# Altium project Carrier-Board-v1.0.PrjPcb (part 8 of 9)

## Sheet LTE_MODULE.SchDoc
size A4; SheetNumber: 19; SheetTotal: 20
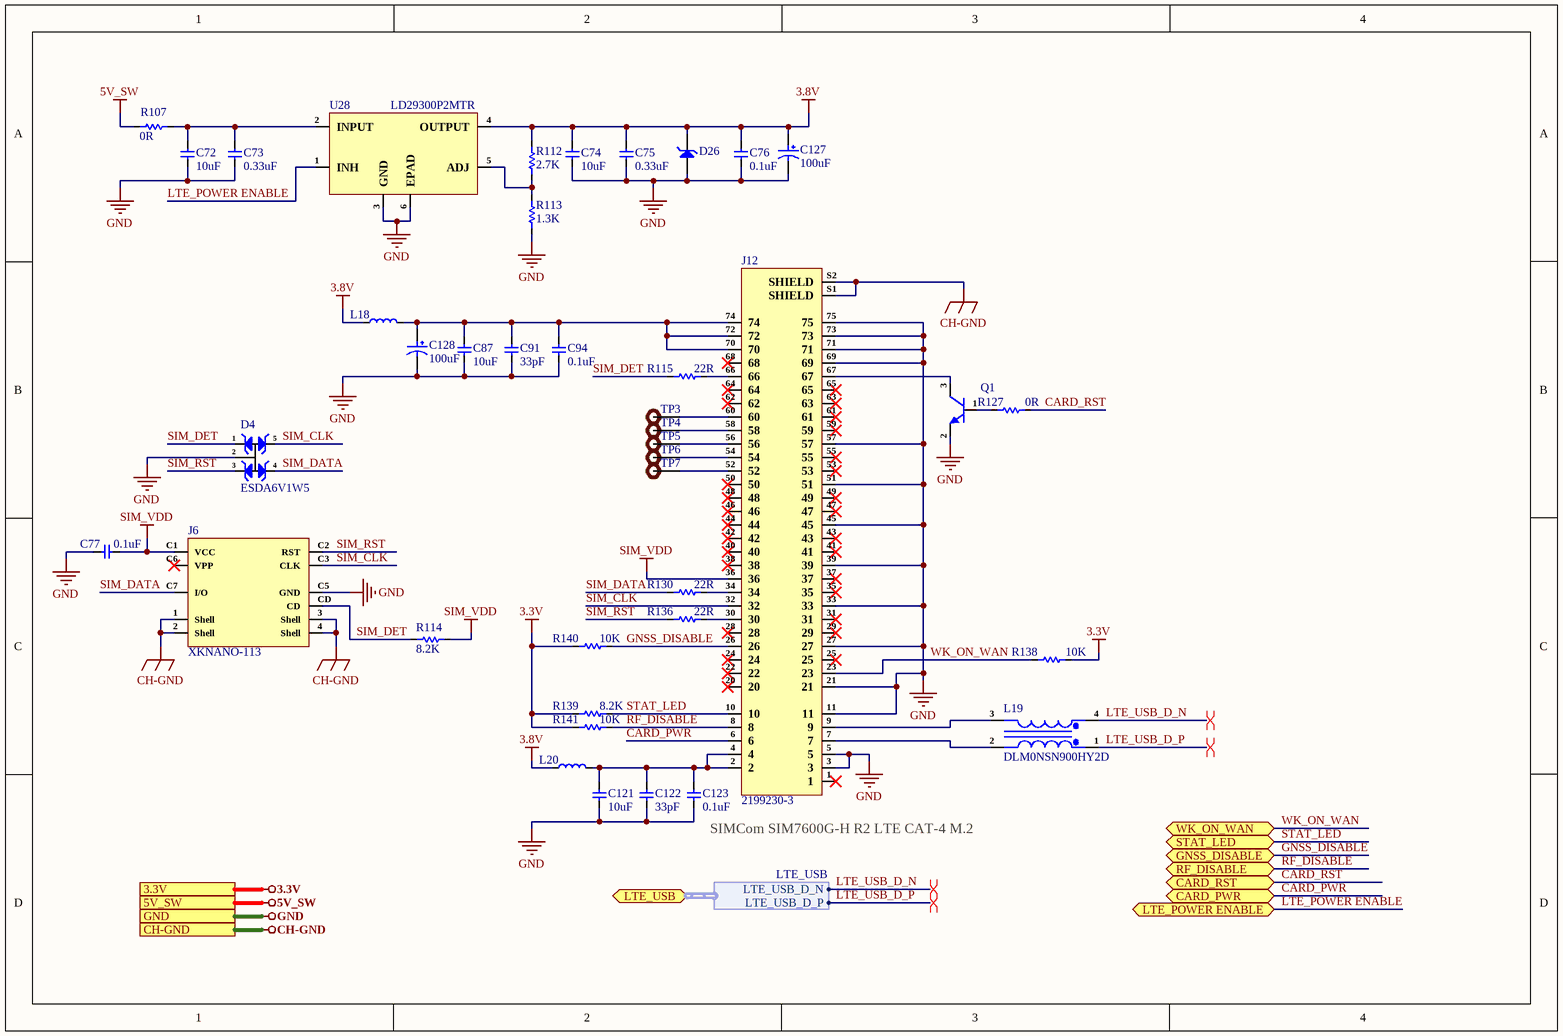
[diagram p18: LTE_MODULE.SchDoc]

### Parts
C72  10uF  [Cap-1206]
C73  0.33uF  [Cap-0603]
C74  10uF  [Cap-1206]
C75  0.33uF  [Cap-0603]
C76  0.1uF  [Cap-0402]
C77  0.1uF  [Cap-0402]
C87  10uF  [Cap-1206]
C91  33pF  [Cap-0603]
C94  0.1uF  [Cap-0402]
C121  10uF  [Cap-1206]
C122  33pF  [Cap-0603]
C123  0.1uF  [Cap-0402]
C127  100uF  [CAP-2917]
C128  100uF  [CAP-2917]
D4  ESDA6V1W5  [SOT-323-5]
D26  PZU3.9B2A,115  [SOD-323]  (value not drawn)
J6  XKNANO-113  [XKNANO-113]
J12  2199230-3  [2199230-3]
L18  BLM21PG220SN1D  [Ind-0805]  (value not drawn)
L19  DLM0NSN900HY2D  [DLM0NSN900HY2D]
L20  BLM21PG220SN1D  [Ind-0805]  (value not drawn)
Q1  DTC043ZEBTL  [SOT-416FL]  (value not drawn)
R107  0R  [Res-1206]
R112  2.7K  [Res-0603]
R113  1.3K  [Res-0603]
R114  8.2K  [Res-0603]
R115  22R  [Res-0402]
R127  0R  [Res-0603]
R130  22R  [Res-0402]
R136  22R  [Res-0402]
R138  10K  [Res-0603]
R139  8.2K  [Res-0603]
R140  10K  [Res-0603]
R141  10K  [Res-0603]
TP3  DNP  [Test-point]  (value not drawn)
TP4  DNP  [Test-point]  (value not drawn)
TP5  DNP  [Test-point]  (value not drawn)
TP6  DNP  [Test-point]  (value not drawn)
TP7  DNP  [Test-point]  (value not drawn)
U28  LD29300P2MTR  [P2PAK-4]

### Ports
3.3V (see Top_Sheet[4A], 03-CAN2_SPI_CAN_CONTROLLER[1D], APALIS_POWER_SUPPLY[1D], CAN2_SPI_CAN_CONTROLLER[1D], DC_DC_CONVERTER[1D], GPIO_NC_INTERFACE[4B], I2C_INTERFACE[1B], Reset_and_SDIO[1D]), 5V_SW (see Top_Sheet[4A], APALIS_POWER_SUPPLY[1D], CODEC_INTERFACE[1D], FUTURE_USE_CONNECTOR[1D], HDMI_INTERFACE[1D], USB3.0_INTERFACE[1D]), CARD_PWR (bidir, see Top_Sheet[4A], I2C_INTERFACE[2B]), CARD_RST (bidir, see Top_Sheet[4A], I2C_INTERFACE[2B]), CH-GND (see Top_Sheet[4A], ETHERNET_INTERFACE[1D], HDMI_INTERFACE[1D], MECHANICAL_FOR_PCB[1D], USB3.0_INTERFACE[1D]), GND (see Top_Sheet[4A], 03-CAN2_SPI_CAN_CONTROLLER[1D], APALIS_POWER_SUPPLY[1D], CAN2_SPI_CAN_CONTROLLER[1D], CODEC_INTERFACE[1D], CONNECTORS[1D], DC_DC_CONVERTER[1D], DIGITAL_I-O_O-P[1D], ETHERNET_INTERFACE[1D], FUTURE_USE_CONNECTOR[1D], GPIO_NC_INTERFACE[4B], HDMI_INTERFACE[1D], I2C_INTERFACE[1B], INPUT_SUPPLY_PROTECTION[1D], MECHANICAL_FOR_PCB[1D], MICRO_SD_CARD_INTERFACE[1D], Reset_and_SDIO[1D], UART_INTERFACE[1D], USB3.0_INTERFACE[1D]), GNSS_DISABLE (bidir, see Top_Sheet[4A], GPIO_NC_INTERFACE[2D]), LTE_POWER ENABLE (bidir, see Top_Sheet[4A], I2C_INTERFACE[2B]), LTE_USB (bidir, harness LTE_USB, see Top_Sheet[4A], USB3.0_INTERFACE[1C]), RF_DISABLE (bidir, see Top_Sheet[4A], GPIO_NC_INTERFACE[2D]), STAT_LED (bidir, see Top_Sheet[4A], GPIO_NC_INTERFACE[4D]), WK_ON_WAN (bidir, see Top_Sheet[4A], GPIO_NC_INTERFACE[4D])

### Harnesses
LTE_USB: LTE_USB_D_N, LTE_USB_D_P

### Nets
3.3V: R138.2 R139.1 R140.1 R141.1 ; port 3.3V
3.8V: C74.2 C75.2 C76.2 C127.1 D26.1(K) L18.1 L20.1 R112.2 U28.4(OUTPUT)
5V_SW: R107.1 ; port 5V_SW
CH-GND: J6.1(Shell) J6.2(Shell) J6.3(Shell) J6.4(Shell) J12.S1(SHIELD) J12.S2(SHIELD) ; port CH-GND
GND: C72.1 C73.1 C74.1 C75.1 C76.1 C77.2 C87.1 C91.1 C94.1 C121.1 C122.1 C123.1 C127.2 C128.2 D4.2(A) D26.2(A) J6.C5(GND) J12.3 J12.5 J12.11 J12.21 J12.27 J12.33 J12.39 J12.45 J12.51 J12.57 J12.69 J12.71 J12.73 J12.75 Q1.2(E) R113.1 U28.3(GND) U28.6(EPAD) ; port GND
SIM_VDD: C77.1 J6.C1(VCC) J12.36 R114.2
CARD_PWR: J12.6 ; port CARD_PWR
CARD_RST: R127.2 ; port CARD_RST
GNSS_DISABLE: J12.26 R140.2 ; port GNSS_DISABLE
LTE_POWER ENABLE: U28.1(INH) ; port LTE_POWER ENABLE
LTE_USB_D_N: L19.4 ; port LTE_USB.LTE_USB_D_N  [project net LTE_USB.LTE_USB_D_N]
LTE_USB_D_P: L19.1 ; port LTE_USB.LTE_USB_D_P  [project net LTE_USB.LTE_USB_D_P]
RF_DISABLE: J12.8 R141.2 ; port RF_DISABLE
SIM_CLK: D4.5(K) J6.C3(CLK) J12.32
SIM_DATA: D4.4(K) J6.C7(I/O) R130.1
SIM_DET: D4.1(K) J6.CD R114.1 R115.1
SIM_RST: D4.3(K) J6.C2(RST) R136.1
STAT_LED: J12.10 R139.2 ; port STAT_LED
WK_ON_WAN: J12.23 R138.1 ; port WK_ON_WAN
NetC72_2: C72.2 C73.2 R107.2 U28.2(INPUT)
NetC87_2: C87.2 C91.2 C94.2 C128.1 J12.70 J12.72 J12.74 L18.2
NetC121_2: C121.2 C122.2 C123.2 J12.2 J12.4 L20.2
NetJ12_7: J12.7 L19.2
NetJ12_9: J12.9 L19.3
NetJ12_30: J12.30 R136.2
NetJ12_34: J12.34 R130.2
NetJ12_52: J12.52 TP7.1
NetJ12_54: J12.54 TP6.1
NetJ12_56: J12.56 TP5.1
NetJ12_58: J12.58 TP4.1
NetJ12_60: J12.60 TP3.1
NetJ12_66: J12.66 R115.2
NetJ12_67: J12.67 Q1.3(C)
NetQ1_1: Q1.1(B) R127.1
NetR112_1: R112.1 R113.2 U28.5(ADJ)

Not connected (* = marked no-connect by the designer): J6 C6(VPP)*; J12 1* 20* 22* 24* 25* 28* 29* 31* 35* 37* 38* 40* 41* 42* 43* 44* 46* 47* 48* 49* 50* 53* 55* 59* 61* 62* 63* 64* 65* 68*

### Layout directives
differential pair; differential pair class LTE USB; rule Matched Net Lengths [Tolerance = 0.508mm]; rule Impedance Constraint [Min = 115.0    Max = 125.0    ]: LTE_USB.LTE_USB_D_N, LTE_USB.LTE_USB_D_P

### Notes on the sheet
- SIMCom SIM7600G-H R2 LTE CAT-4 M.2

### Library data of the parts
C72 C74 C87 C121 = C1206C106K4RACAUTO: CAP CER 10UF 16V X7R 1206; Manufacturer: KEMET; Supplier: Mouser; Supplier Part Number: 80-C1206C106K4RAUTO; Manufacturer Part Number: C1206C106K4RACAUTO; RoHS: Yes; Category: Ceramic Capacitors; Stock: 96894; Pricing: 1=0.45, 10=0.218, 50=0.218, 100=0.141, 1000=0.119, 10000=0.096 (USD); ComponentLink1URL: https://datasheet.ciiva.com/5969/1776110-5969442.pdf?src-supplier=Farnell; ComponentLink1Description: https://datasheet.ciiva.com/5969/1776110-5969442.pdf?src-supplier=Farnell; ComponentLink2URL: https://datasheet.ciiva.com/7729/1776110-7729820.pdf?src-supplier=Element14; ComponentLink2Description: https://datasheet.ciiva.com/7729/1776110-7729820.pdf?src-supplier=Element14; ComponentLink3URL: https://datasheet.ciiva.com/22704/1776110-22704890.pdf?src-supplier=Element14; ComponentLink3Description: https://datasheet.ciiva.com/22704/1776110-22704890.pdf?src-supplier=Element14
C73 C75 = CGA3E1X7R1C334K080AC: CAP CER 0.33UF 16V X7R 0603; Manufacturer: TDK; Material: 4241ConductorMaterial; Supplier: Avnet; Supplier Part Number: 52W9636; Manufacturer Part Number: CGA3E1X7R1C334K080AC; RoHS: Yes; Category: Ceramic Capacitors; Stock: 4000; Pricing: 1=0.023 (USD); ComponentLink1URL: https://datasheet.ciiva.com/26834/getdatasheetpartid-734961-26834531.pdf?src-supplier=Verical; ComponentLink1Description: https://datasheet.ciiva.com/26834/getdatasheetpartid-734961-26834531.pdf?src-supplier=Verical; ComponentLink2URL: https://datasheet.ciiva.com/24217/cga3e1x7r1c334k080ac-265890-24217429.pdf?src-supplier=Mouser; ComponentLink2Description: https://datasheet.ciiva.com/24217/cga3e1x7r1c334k080ac-265890-24217429.pdf?src-supplier=Mouser; ComponentLink3URL: https://datasheet.ciiva.com/7975/1807242-7975343.pdf?src-supplier=Element14; ComponentLink3Description: https://datasheet.ciiva.com/7975/1807242-7975343.pdf?src-supplier=Element14
C76 C77 C94 C123 = C0402C104K4REC7867: as C59 on sheet FUTURE_USE_CONNECTOR; Supplier: Digi-Key; Supplier Part Number: 399-C0402C104K4REC7867CT-ND; Manufacturer Part Number: C0402C104K4REC7867; RoHS: No; Category: Ceramic Capacitors; Stock: 10918; Pricing: 1=0.1, 10=0.072, 50=0.0408, 100=0.0338, 500=0.02372, 1000=0.01963, 2500=0.01827, 5000=0.01672 (USD)
C91 C122 = C0603C330J5GACTU: Multilayer Ceramic Capacitor, 33 pF, 50 V, ± 5%, C0G (NP0), 0603 [1608 Metric]; Manufacturer: KEMET; Material: 4241ConductorMaterial; Voltage Rating (DC): 50V; Temperature Coefficient: 30ppm/°C; Dissipation Factor: 0.1%; Supplier: Mouser; Supplier Part Number: 80-C0603C330J5G; Manufacturer Part Number: C0603C330J5GACTU; RoHS: Yes; Category: Ceramic Capacitors; Stock: 156407; Pricing: 1=0.14, 10=0.055, 50=0.055, 100=0.032, 1000=0.027, 10000=0.019 (USD); Mounting Technology: Surface Mount,PCB; Case/Package: 0603; Pins: 2; Case Code (Metric): 1608; Case Code (Imperial): 0603; Min Operating Temperature: -55°C; Max Operating Temperature: 125°C; Value: 33pF; Tolerance: 5%; Packaging: Tape and Reel; Dielectric: C0G; Package Quantity: 4000; Voltage Rating: 50V; Termination: SMD/SMT; Voltage: 50V; Series: SMD Comm C0G; Construction: Flat; Length: 1.6mm; Width: 0.8mm; Height: 0.8mm; Lead Pitch: 0.7mm; Depth: 0.8mm; Radiation Hardening: No; Reach SVHC Compliant: No; Lead Free: 5697LeadFree; RoHS Compliant: Yes; ComponentLink1URL: https://datasheet.ciiva.com/6177/1732690-6177173.pdf?src-supplier=Farnell; ComponentLink1Description: https://datasheet.ciiva.com/6177/1732690-6177173.pdf?src-supplier=Farnell; ComponentLink2URL: https://datasheet.ciiva.com/7823/1732690-7823738.pdf?src-supplier=Element14; ComponentLink2Description: https://datasheet.ciiva.com/7823/1732690-7823738.pdf?src-supplier=Element14; ComponentLink3URL: https://datasheet.ciiva.com/7824/kem-c1003-c0g-smd-7824030.pdf?src-supplier=Element14; ComponentLink3Description: https://datasheet.ciiva.com/7824/kem-c1003-c0g-smd-7824030.pdf?src-supplier=Element14; ComponentLink4URL: https://datasheet.ciiva.com/28668/1789732-28668661.pdf?src-supplier=Element14; ComponentLink4Description: https://datasheet.ciiva.com/28668/1789732-28668661.pdf?src-supplier=Element14; Item Type: Capacitor
C127 C128 = TAJD107M020RNJ: Cap Tant Solid 100uF 20V D CASE 20% (7.3 X 4.3 X 2.9mm) Inward L SMD 7343-31 0.5 Ohm 125C T/R; Manufacturer: Kyocera AVX; Life (Hours): 2000Hour; Ripple Current: 548mA; Supplier: Digi-Key; Supplier Part Number: 478-8907-1-ND; Manufacturer Part Number: TAJD107M020RNJ; RoHS: Yes; Category: Tantalum Capacitors; Stock: 1507; Pricing: 1=1.27, 10=1.006, 50=0.8716, 100=0.7542 (USD); ComponentLink1URL: https://datasheet.ciiva.com/29503/taj-29503388.pdf?src-supplier=Digi-Key; ComponentLink1Description: https://datasheet.ciiva.com/29503/taj-29503388.pdf?src-supplier=Digi-Key; ComponentLink2URL: https://datasheet.ciiva.com/29503/taj-29503389.pdf?src-supplier=Digi-Key; ComponentLink2Description: https://datasheet.ciiva.com/29503/taj-29503389.pdf?src-supplier=Digi-Key; ComponentLink3URL: https://datasheet.ciiva.com/29503/taj-29503390.pdf?src-supplier=Digi-Key; ComponentLink3Description: https://datasheet.ciiva.com/29503/taj-29503390.pdf?src-supplier=Digi-Key; ComponentLink4URL: https://datasheet.ciiva.com/12886/taj-27497-12886634.pdf?src-supplier=Mouser; ComponentLink4Description: https://datasheet.ciiva.com/12886/taj-27497-12886634.pdf?src-supplier=Mouser; ComponentLink5URL: https://datasheet.ciiva.com/11229/taj-11229143.pdf?src-supplier=Avnet; ComponentLink5Description: https://datasheet.ciiva.com/11229/taj-11229143.pdf?src-supplier=Avnet
D4 = ESDA6V1W5: TVS DIODE 3VWM SOT3235; Manufacturer: STMicroelectronics; Direction: Unidirectional; Number of Elements: 4; Capacitance: 90pF; Reverse Breakdown Voltage: 6.1V; Operating Supply Voltage: 3V; Element Configuration: Common Anode; Breakdown Voltage: 7.2V; Peak Pulse Power: 150W; Power Line Protection: No; Leakage Current: 1uA; Test Current: 1mA; ESD Protection: Yes; Peak Pulse Current: 15A; Diode Type: ZENER; Supplier 1: Arrow Electronics; Manufacturer Part Number: ESDA6V1W5; RoHS: Yes; Category: TVS Diodes; Stock 1: 3304; Pricing 1: 1=0.46690, 10=0.38770, 25=0.37260, 100=0.27930, 250=0.27650, 500=0.23480, 1000=0.21350, 3000=0.10000 (USD); Mount: Surface Mount; Case/Package: SOT-323; Number of Pins: 5; Min Operating Temperature: -40°C; Max Operating Temperature: 125°C; Packaging: Tape and Reel; Package Quantity: 1; Polarity: Unidirectional; Number of Channels: 4; Termination: SMD/SMT; Number of Unidirectional Channels: 4; Reverse Standoff Voltage: 3V; Min Breakdown Voltage: 6.1V; Working Voltage: 3V; Max Reverse Leakage Current: 1uA; Max Breakdown Voltage: 7.2V; Voltage Rating (DC): 6.1V; Resistor Type: Zener; Series: ESDA, TRANSIL™; Length: 2.2mm; Width: 1.35mm; Height: 1mm; Depth: 1.35mm; Radiation Hardening: No; Reach SVHC Compliant: Yes; Lead Free: Lead Free; RoHS Compliant: Yes; ComponentLink1URL: https://datasheet.ciiva.com/15143/getdatasheetpartid-134557-15143650.pdf?src-supplier=Verical; ComponentLink1Description: https://datasheet.ciiva.com/15143/getdatasheetpartid-134557-15143650.pdf?src-supplier=Verical; ComponentLink2URL: https://datasheet.ciiva.com/1276/1671027-1276908.pdf?src-supplier=Element14; ComponentLink2Description: https://datasheet.ciiva.com/1276/1671027-1276908.pdf?src-supplier=Element14; ComponentLink3URL: https://datasheet.ciiva.com/22695/1671027-22695673.pdf?src-supplier=Element14; ComponentLink3Description: https://datasheet.ciiva.com/22695/1671027-22695673.pdf?src-supplier=Element14; ComponentLink4URL: https://datasheet.ciiva.com/338/cd00064033-338380.pdf?src-supplier=Digi-Key; ComponentLink4Description: https://datasheet.ciiva.com/338/cd00064033-338380.pdf?src-supplier=Digi-Key; ComponentLink5URL: https://datasheet.ciiva.com/338/cd00064033-338379.pdf?src-supplier=Digi-Key; ComponentLink5Description: https://datasheet.ciiva.com/338/cd00064033-338379.pdf?src-supplier=Digi-Key; ComponentLink6URL: https://datasheet.ciiva.com/338/cd00064033-338381.pdf?src-supplier=Digi-Key; ComponentLink6Description: https://datasheet.ciiva.com/338/cd00064033-338381.pdf?src-supplier=Digi-Key; ComponentLink7URL: https://datasheet.ciiva.com/41443/001184222-da-01-en-transil-array-da-esda6v1w5-sot-323-5-stm-41443642.pdf?src-supplier=Conrad; ComponentLink7Description: https://datasheet.ciiva.com/41443/001184222-da-01-en-transil-array-da-esda6v1w5-sot-323-5-stm-41443642.pdf?src-supplier=Conrad; Supplier Part Number 1: ESDA6V1W5; LCSC Part Number: C48677; Item Type: Diode
D26 = PZU3.9B2A,115: DIODE ZENER 3.9V 320MW SOD323; Manufacturer: Nexperia; Impedance: 90R; Max Reverse Leakage Current: 1uA; Power Dissipation: 310mW; Tolerance: 2%; Voltage Tolerance: 5%; Zener Current: 200mA; Element Configuration: 5460ElementConfiguration; Supplier: Avnet; Supplier Part Number: PZU3.9B2A,115; Manufacturer Part Number: PZU3.9B2A,115; RoHS: Yes; Category: Zener Diodes; Stock: 76880; Pricing: 13228=0.02646, 14000=0.02589, 27000=0.02533, 67000=0.02476, 140000=0.02419, 670000=0.02363, 1400000=0.02306 (USD); Mounting Technology: 8Mount; Case/Package: 92Case; Min Operating Temperature: -55°C; Max Operating Temperature: 150°C; Max Power Dissipation: 320mW; Packaging: 10Packaging; Zener Voltage: 3.9V; Radiation Hardening: 5898YesNo; RoHS Compliant: Yes; ComponentLink1URL: https://datasheet.octopart.com/PZU3.9B2A%2C115-Nexperia-datasheet-140812947.pdf?src-supplier=Farnell; ComponentLink1Description: https://datasheet.octopart.com/PZU3.9B2A%2C115-Nexperia-datasheet-140812947.pdf?src-supplier=Farnell; Item Type: Diode Zener
J6 = XKNANO-113: Copper Alloy Self bomb Gold plating 1.25mm Deck -40℃~+85℃ 260℃ NanoSIM SMD SIM Card Connectors ROHS; Manufacturer: XKB Connectivity; Manufacturer Part Number: XKNANO-113; Package: SMD Custom; LCSC Part Number: C381071; Item Type: SIM Card Connectors; ComponentLink1Description: LCSC; ComponentLink1URL: https://www.lcsc.com/product-detail/SIM-Card-Connectors_XKB-Connectivity-XKNANO-113_C381071.html
J12 = 2199230-3: M2 KEY B Connector .5PITCH 4.2H KEY B EMBOSS NGFF MINICARD; Manufacturer: TE Connectivity; Gender: Female; Number of Positions: 67; PCB Mounting Orientation: Right Angle; Contact Current Rating: 500mA; Voltage Rating: 50V; Insulation Resistance: 500MR; Pitch: 0.5mm; Row Spacing: 7.55mm; Supplier: Rs; Supplier Part Number: 2175444; Manufacturer Part Number: 2199230-3; RoHS: Yes; Category: Card Edge Connectors; Stock: 5895; Pricing: 1000=0.84 (GBP); Mounting Technology: Surface Mount; Contact Plating: Gold,Matte; Contact Material: Copper Alloy; Color: Black; Housing Color: Black; Insulation Material: Thermoplastic; Housing Material: Thermoplastic; Min Operating Temperature: -40°C; Max Operating Temperature: 80°C; Number of Rows: 2; Packaging: Tape and Reel; Package Quantity: 1000; Termination: Solder; Series: -; Contact Type: -; Current Rating: 500mA; Number of Contacts: 67; Orientation: Right Angle; Max Voltage Rating (AC): 50V; Length: 0.862inch; Width: 8.7mm; Height: 0.165inch; Radiation Hardening: No; ELV: Compliant; RoHS Compliant: Yes; Reach SVHC Compliant: Unknown
L18 L20 = BLM21PG220SN1D: FERRITE BEAD 22 OHM 0805 1LN; Manufacturer: Murata; Supplier: Rs; Supplier Part Number: 7241539P; Manufacturer Part Number: BLM21PG220SN1D; RoHS: Yes; Category: Ferrite Beads and Chips; Stock: 10325; Pricing: 500=0.043, 1000=0.038, 2500=0.033, 5000=0.03 (GBP); ComponentLink1URL: https://datasheet.ciiva.com/14122/anblm21p-data-e-14122211.pdf?src-supplier=Distrelec; ComponentLink1Description: https://datasheet.ciiva.com/14122/anblm21p-data-e-14122211.pdf?src-supplier=Distrelec; ComponentLink2URL: https://datasheet.ciiva.com/11799/0900766b81275e31-11799177.pdf?src-supplier=Rs; ComponentLink2Description: https://datasheet.ciiva.com/11799/0900766b81275e31-11799177.pdf?src-supplier=Rs; ComponentLink3URL: https://datasheet.ciiva.com/29700/1845312-29700540.pdf?src-supplier=Jameco; ComponentLink3Description: https://datasheet.ciiva.com/29700/1845312-29700540.pdf?src-supplier=Jameco; ComponentLink4URL: https://datasheet.ciiva.com/16291/l0110s0100blm21p-16291622.pdf?src-supplier=Future+Electronics; ComponentLink4Description: https://datasheet.ciiva.com/16291/l0110s0100blm21p-16291622.pdf?src-supplier=Future+Electronics; ComponentLink5URL: https://datasheet.ciiva.com/8021/5160-8021589.pdf?src-supplier=Element14; ComponentLink5Description: https://datasheet.ciiva.com/8021/5160-8021589.pdf?src-supplier=Element14; ComponentLink6URL: https://datasheet.ciiva.com/8021/5160-8021591.pdf?src-supplier=Element14; ComponentLink6Description: https://datasheet.ciiva.com/8021/5160-8021591.pdf?src-supplier=Element14; ComponentLink7URL: https://datasheet.ciiva.com/6211/l0110s0100blm21p-6211741.pdf?src-supplier=Digi-Key; ComponentLink7Description: https://datasheet.ciiva.com/6211/l0110s0100blm21p-6211741.pdf?src-supplier=Digi-Key; ComponentLink8URL: https://datasheet.ciiva.com/3081/l0110s0100blm21p-3081653.pdf?src-supplier=Avnet; ComponentLink8Description: https://datasheet.ciiva.com/3081/l0110s0100blm21p-3081653.pdf?src-supplier=Avnet; ComponentLink9URL: https://datasheet.ciiva.com/41449/001171738-da-01-en-chip-drossel0805-22r0-6000ma-2-0x1-25mm-41449366.pdf?src-supplier=Conrad; ComponentLink9Description: https://datasheet.ciiva.com/41449/001171738-da-01-en-chip-drossel0805-22r0-6000ma-2-0x1-25mm-41449366.pdf?src-supplier=Conrad; LCSC Part Number: C88993; Item Type: Ferrite Bead
L19 = DLM0NSN900HY2D: CMC 100MA 2LN 90 OHM SMD; Manufacturer: Murata; Impedance: 90R; Number of Lines: 2; Voltage Rating (DC): 5V; Supplier: Rs; Supplier Part Number: 2235027P; Manufacturer Part Number: DLM0NSN900HY2D; RoHS: Yes; Category: Common Mode Chokes; Stock: 4650; Pricing: 250=0.066, 500=0.054, 1000=0.05, 2500=0.043 (GBP); Mounting Technology: Surface Mount; Case Code (Imperial): 0302; Case Code (Metric): 0806; Min Operating Temperature: -40°C; Max Operating Temperature: 85°C; Series: -; Max Current Rating: 100mA; Length: 850um; Width: 650um; RoHS Compliant: Yes; ComponentLink1URL: https://datasheet.octopart.com/DLM0NSN900HY2D-Murata-datasheet-140316808.pdf?src-supplier=Element14; ComponentLink1Description: https://datasheet.octopart.com/DLM0NSN900HY2D-Murata-datasheet-140316808.pdf?src-supplier=Element14; ComponentLink2URL: https://www.murata.com/en-global/products/productdata/8799424610334/EFLD0009.pdf?src-supplier=Digi-Key; ComponentLink2Description: https://www.murata.com/en-global/products/productdata/8799424610334/EFLD0009.pdf?src-supplier=Digi-Key; ComponentLink3URL: https://datasheet.octopart.com/DLM0NSN900HY2D-Murata-datasheet-140316808.pdf?src-supplier=Newark; ComponentLink3Description: https://datasheet.octopart.com/DLM0NSN900HY2D-Murata-datasheet-140316808.pdf?src-supplier=Newark
Q1 = DTC043ZEBTL: TRANS PREBIAS NPN 50V EMT3F; Manufacturer: Rohm; Supplier: Mouser; Supplier Part Number: 755-DTC043ZEBTL; Manufacturer Part Number: DTC043ZEBTL; RoHS: Yes; Category: BJTs; Stock: 9280; Pricing: 1=0.19, 10=0.182, 50=0.182, 100=0.099, 1000=0.042, 10000=0.031 (USD); ComponentLink1URL: http://www.mouser.com/ds/2/348/tc043zebtl-e-1019210.pdf?src-supplier=Mouser; ComponentLink1Description: http://www.mouser.com/ds/2/348/tc043zebtl-e-1019210.pdf?src-supplier=Mouser; ComponentLink2URL: http://www.farnell.com/datasheets/2644341.pdf?src-supplier=Newark; ComponentLink2Description: http://www.farnell.com/datasheets/2644341.pdf?src-supplier=Newark; ComponentLink3URL: https://datasheet.octopart.com/DTC043ZEBTL-Rohm-datasheet-136771937.pdf?src-supplier=Future+Electronics; ComponentLink3Description: https://datasheet.octopart.com/DTC043ZEBTL-Rohm-datasheet-136771937.pdf?src-supplier=Future+Electronics; ComponentLink4URL: http://rohmfs.rohm.com/en/techdata_basic/transistor/taping/EMT3_TL_taping.pdf?src-supplier=Digi-Key; ComponentLink4Description: http://rohmfs.rohm.com/en/techdata_basic/transistor/taping/EMT3_TL_taping.pdf?src-supplier=Digi-Key; ComponentLink5URL: http://rohmfs.rohm.com/en/products/databook/datasheet/discrete/transistor/digital/dtc043zmt2l-e.pdf?src-supplier=Digi-Key; ComponentLink5Description: http://rohmfs.rohm.com/en/products/databook/datasheet/discrete/transistor/digital/dtc043zmt2l-e.pdf?src-supplier=Digi-Key; ComponentLink6URL: http://avnetexpress.avnet.com/store/em/EMController/Digital-BJT/Rohm-Semiconductor/DTC043ZEBTL/_/R-16023578/A-16023578/rohmfs.rohm.com/en/products/databook/datasheet/discrete/transistor/digital/dtc043zeb.pdf?src-supplier=Avnet; ComponentLink6Description: http://avnetexpress.avnet.com/store/em/EMController/Digital-BJT/Rohm-Semiconductor/DTC043ZEBTL/_/R-16023578/A-16023578/rohmfs.rohm.com/en/products/databook/datasheet/discrete/transistor/digital/dtc043zeb.pdf?src-supplier=Avnet
R107 = RC1206JR-070RL: as R137 on sheet DC_DC_CONVERTER; Supplier: Future Electronics; Supplier Part Number: 1070203; Manufacturer Part Number: RC1206JR-070RL; RoHS: Yes; Category: Chip SMD Resistors; Stock: 615000; Pricing: 5000=0.0047, 25000=0.0045, 100000=0.0042, 250000=0.0041, 625000=0.0038 (USD); Case/Package: 1206; Contact Plating: Tin,Matte; Case Code (Metric): 3216; Case Code (Imperial): 1206; Min Operating Temperature: -55°C; Max Operating Temperature: 155°C; Resistor Type: Thick Film,Carbon Film; Packaging: Tape and Reel; Package Quantity: 1; Number of Terminations: 2; Termination: SMD/SMT; Max Power Dissipation: 250mW; Series: RC; Resistance Tolerance: 5%; Technology: THICK FILM; Features: Moisture Resistant; Voltage Rating (AC): 200V; Length: 0.122inch; Width: 0.063inch; Height: 0.026inch; Depth: 1.6mm; Lead Free: Lead Free; RoHS Compliant: Yes; Reach SVHC Compliant: Unknown; ComponentLink1URL: https://datasheet.ciiva.com/11808/0900766b80c6630a-11808156.pdf?src-supplier=Rs; ComponentLink1Description: https://datasheet.ciiva.com/11808/0900766b80c6630a-11808156.pdf?src-supplier=Rs; ComponentLink2URL: https://datasheet.ciiva.com/29181/402222-da-01-en-smd-widerstand-0-ohm-1206-29181568.pdf?src-supplier=Conrad; ComponentLink2Description: https://datasheet.ciiva.com/29181/402222-da-01-en-smd-widerstand-0-ohm-1206-29181568.pdf?src-supplier=Conrad; ComponentLink3URL: https://datasheet.ciiva.com/7983/444357-7983807.pdf?src-supplier=Element14; ComponentLink3Description: https://datasheet.ciiva.com/7983/444357-7983807.pdf?src-supplier=Element14; ComponentLink4URL: https://datasheet.ciiva.com/22747/1692832-22747541.pdf?src-supplier=Element14; ComponentLink4Description: https://datasheet.ciiva.com/22747/1692832-22747541.pdf?src-supplier=Element14; ComponentLink5URL: https://datasheet.ciiva.com/46445/444357-46445719.pdf?src-supplier=Element14; ComponentLink5Description: https://datasheet.ciiva.com/46445/444357-46445719.pdf?src-supplier=Element14; ComponentLink6URL: https://datasheet.ciiva.com/2458/pyu-rc1206-51-rohs-l-4-2458669.pdf?src-supplier=Digi-Key; ComponentLink6Description: https://datasheet.ciiva.com/2458/pyu-rc1206-51-rohs-l-4-2458669.pdf?src-supplier=Digi-Key; ComponentLink7URL: https://datasheet.ciiva.com/2458/pyu-rc1206-51-rohs-l-4-2458670.pdf?src-supplier=Digi-Key; ComponentLink7Description: https://datasheet.ciiva.com/2458/pyu-rc1206-51-rohs-l-4-2458670.pdf?src-supplier=Digi-Key; ComponentLink8URL: https://datasheet.ciiva.com/2458/pyu-rc1206-51-rohs-l-4-2458668.pdf?src-supplier=Digi-Key; ComponentLink8Description: https://datasheet.ciiva.com/2458/pyu-rc1206-51-rohs-l-4-2458668.pdf?src-supplier=Digi-Key; ComponentLink9URL: https://datasheet.ciiva.com/7857/1692832-7857422.pdf?src-supplier=Element14; ComponentLink9Description: https://datasheet.ciiva.com/7857/1692832-7857422.pdf?src-supplier=Element14; ComponentLink10URL: https://datasheet.ciiva.com/7857/1692832-7857421.pdf?src-supplier=Element14; ComponentLink10Description: https://datasheet.ciiva.com/7857/1692832-7857421.pdf?src-supplier=Element14; ComponentLink11URL: https://datasheet.ciiva.com/17035/pyu-rc1206-51-rohs-l-4-17035512.pdf?src-supplier=Future+Electronics; ComponentLink11Description: https://datasheet.ciiva.com/17035/pyu-rc1206-51-rohs-l-4-17035512.pdf?src-supplier=Future+Electronics
R112 = ERA-3AEB272V: as R37 on sheet INPUT_SUPPLY_PROTECTION; Supplier: Mouser; Supplier Part Number: 667-ERA-3AEB272V; Manufacturer Part Number: ERA-3AEB272V; RoHS: Yes; Category: Chip SMD Resistors; Stock: 13910; Pricing: 1=0.34, 10=0.224, 50=0.224, 100=0.09, 1000=0.05, 10000=0.036 (USD); ComponentLink1URL: https://datasheet.ciiva.com/11808/0900766b80fe20f7-11808049.pdf?src-supplier=Rs; ComponentLink1Description: https://datasheet.ciiva.com/11808/0900766b80fe20f7-11808049.pdf?src-supplier=Rs; ComponentLink2URL: https://datasheet.ciiva.com/29183/450927-da-01-en-widerstand-0603-era-29183778.pdf?src-supplier=Conrad; ComponentLink2Description: https://datasheet.ciiva.com/29183/450927-da-01-en-widerstand-0603-era-29183778.pdf?src-supplier=Conrad; ComponentLink3URL: https://datasheet.ciiva.com/9196/aoa0000ce26-9196935.pdf?src-supplier=Avnet; ComponentLink3Description: https://datasheet.ciiva.com/9196/aoa0000ce26-9196935.pdf?src-supplier=Avnet; ComponentLink4URL: https://datasheet.ciiva.com/43457/485442-43457768.pdf?src-supplier=Farnell; ComponentLink4Description: https://datasheet.ciiva.com/43457/485442-43457768.pdf?src-supplier=Farnell; ComponentLink5URL: https://datasheet.ciiva.com/43455/485442-43455224.pdf?src-supplier=Farnell; ComponentLink5Description: https://datasheet.ciiva.com/43455/485442-43455224.pdf?src-supplier=Farnell; ComponentLink6URL: https://datasheet.ciiva.com/48530/era-eng-tds-48530485.pdf?src-supplier=Distrelec; ComponentLink6Description: https://datasheet.ciiva.com/48530/era-eng-tds-48530485.pdf?src-supplier=Distrelec; ComponentLink7URL: https://datasheet.ciiva.com/48425/era-eng-tds-48425448.pdf?src-supplier=Distrelec; ComponentLink7Description: https://datasheet.ciiva.com/48425/era-eng-tds-48425448.pdf?src-supplier=Distrelec; ComponentLink8URL: https://datasheet.ciiva.com/46422/485442-46422632.pdf?src-supplier=Element14; ComponentLink8Description: https://datasheet.ciiva.com/46422/485442-46422632.pdf?src-supplier=Element14; ComponentLink9URL: https://datasheet.ciiva.com/46422/485442-46422633.pdf?src-supplier=Element14; ComponentLink9Description: https://datasheet.ciiva.com/46422/485442-46422633.pdf?src-supplier=Element14; ComponentLink10URL: https://datasheet.ciiva.com/46422/485442-46422634.pdf?src-supplier=Element14; ComponentLink10Description: https://datasheet.ciiva.com/46422/485442-46422634.pdf?src-supplier=Element14; ComponentLink11URL: https://datasheet.ciiva.com/6000/485442-6000521.pdf?src-supplier=Farnell; ComponentLink11Description: https://datasheet.ciiva.com/6000/485442-6000521.pdf?src-supplier=Farnell; ComponentLink12URL: https://datasheet.ciiva.com/6000/485442-6000524.pdf?src-supplier=Farnell; ComponentLink12Description: https://datasheet.ciiva.com/6000/485442-6000524.pdf?src-supplier=Farnell
R113 = RT0603BRD071K3L: RES SMD 1.3K OHM 0.1% 1/10W 0603; Manufacturer: Yageo; Supplier: Future Electronics; Supplier Part Number: 1104750; Manufacturer Part Number: RT0603BRD071K3L; RoHS: Yes; Category: Chip SMD Resistors; Stock: 25000; Pricing: 5000=0.0354, 15000=0.0341, 25000=0.0335, 50000=0.0327, 100000=0.0315 (USD); ComponentLink1URL: https://datasheet.ciiva.com/8895/pyu-rt-1-to-0-05-rohs-l-4-8895677.pdf?src-supplier=Avnet; ComponentLink1Description: https://datasheet.ciiva.com/8895/pyu-rt-1-to-0-05-rohs-l-4-8895677.pdf?src-supplier=Avnet; ComponentLink2URL: https://datasheet.ciiva.com/2585/pyu-rt-1-to-0-05-rohs-l-4-2585747.pdf?src-supplier=Digi-Key; ComponentLink2Description: https://datasheet.ciiva.com/2585/pyu-rt-1-to-0-05-rohs-l-4-2585747.pdf?src-supplier=Digi-Key; ComponentLink3URL: https://datasheet.ciiva.com/46634/pyu-rt-1-to-0-05-rohs-l-5-46634957.pdf?src-supplier=Digi-Key; ComponentLink3Description: https://datasheet.ciiva.com/46634/pyu-rt-1-to-0-05-rohs-l-5-46634957.pdf?src-supplier=Digi-Key; ComponentLink4URL: https://datasheet.ciiva.com/12811/pyu-rt-1-to-0-05-rohs-l-4-12811930.pdf?src-supplier=Mouser; ComponentLink4Description: https://datasheet.ciiva.com/12811/pyu-rt-1-to-0-05-rohs-l-4-12811930.pdf?src-supplier=Mouser
R114 R139 = RC0603JR-078K2L: RES 8.2K OHM 5% 1/10W 0603; Manufacturer: Yageo; Supplier: Future Electronics; Supplier Part Number: 5790217; Manufacturer Part Number: RC0603JR-078K2L; RoHS: Yes; Category: Chip SMD Resistors; Stock: 755000; Pricing: 5000=0.0015, 75000=0.0015, 250000=0.0014, 750000=0.0013, 2500000=0.0012 (USD); ComponentLink1URL: https://datasheet.ciiva.com/7746/443971-7746543.pdf?src-supplier=Element14; ComponentLink1Description: https://datasheet.ciiva.com/7746/443971-7746543.pdf?src-supplier=Element14; ComponentLink2URL: https://datasheet.ciiva.com/2452/pyu-r-int-thick-7-2452914.pdf?src-supplier=Digi-Key; ComponentLink2Description: https://datasheet.ciiva.com/2452/pyu-r-int-thick-7-2452914.pdf?src-supplier=Digi-Key; ComponentLink3URL: https://datasheet.ciiva.com/2452/pyu-r-int-thick-7-2452915.pdf?src-supplier=Digi-Key; ComponentLink3Description: https://datasheet.ciiva.com/2452/pyu-r-int-thick-7-2452915.pdf?src-supplier=Digi-Key; ComponentLink4URL: https://datasheet.ciiva.com/2452/pyu-r-int-thick-7-2452916.pdf?src-supplier=Digi-Key; ComponentLink4Description: https://datasheet.ciiva.com/2452/pyu-r-int-thick-7-2452916.pdf?src-supplier=Digi-Key
R115 R130 R136 = CRGCQ0402J22R: as R120-R123 on sheet I2C_INTERFACE; Supplier: Avnet; Supplier Part Number: 73AC8982; Manufacturer Part Number: CRGCQ0402J22R; RoHS: Yes; Category: Chip SMD Resistors; Stock: 20000; Pricing: 1=0.036, 25=0.01, 100=0.008, 250=0.006, 500=0.005 (USD); ComponentLink1URL: https://www.te.com/commerce/DocumentDelivery/DDEController?Action=srchrtrv&amp;DocNm=1773204-3&amp;DocType=DS&amp;DocLang=English&src-supplier=Digi-Key; ComponentLink1Description: https://www.te.com/commerce/DocumentDelivery/DDEController?Action=srchrtrv&amp;DocNm=1773204-3&amp;DocType=DS&amp;DocLang=English&src-supplier=Digi-Key; ComponentLink2URL: https://4donline.ihs.com/images/VipMasterIC/IC/TYEL/TYEL-S-A0004929575/TYEL-S-A0004929575-1.pdf?hkey=52A5661711E402568146F3353EA87419&src-supplier=Newark; ComponentLink2Description: https://4donline.ihs.com/images/VipMasterIC/IC/TYEL/TYEL-S-A0004929575/TYEL-S-A0004929575-1.pdf?hkey=52A5661711E402568146F3353EA87419&src-supplier=Newark; ComponentLink3URL: https://4donline.ihs.com/images/VipMasterIC/IC/TYEL/TYEL-S-A0004929575/TYEL-S-A0004929575-1.pdf?hkey=52A5661711E402568146F3353EA87419&src-supplier=Element14; ComponentLink3Description: https://4donline.ihs.com/images/VipMasterIC/IC/TYEL/TYEL-S-A0004929575/TYEL-S-A0004929575-1.pdf?hkey=52A5661711E402568146F3353EA87419&src-supplier=Element14; ComponentLink4URL: https://datasheet.octopart.com/CRGCQ0402J22R-TE-Connectivity-datasheet-114679081.pdf?src-supplier=Master+Electronics; ComponentLink4Description: https://datasheet.octopart.com/CRGCQ0402J22R-TE-Connectivity-datasheet-114679081.pdf?src-supplier=Master+Electronics
R127 = ERJ-3GEY0R00V: as R68 on sheet DC_DC_CONVERTER; Supplier: Mouser; Supplier Part Number: 667-ERJ-3GEY0R00V; Manufacturer Part Number: ERJ-3GEY0R00V; RoHS: Yes; Category: Chip SMD Resistors; Stock: 9094861; Pricing: 1=0.1, 10=0.044, 50=0.044, 100=0.019, 1000=0.008, 5000=0.006, 10000=0.004 (USD); Mounting Technology: Surface Mount; Case/Package: 0603; Contact Plating: Tin; Case Code (Metric): 1608; Case Code (Imperial): 0603; Min Operating Temperature: -55°C; Max Operating Temperature: 155°C; Value: 0R; Resistor Type: Thick Film; Packaging: Tape and Reel; Package Quantity: 5000; Number of Terminations: 2; Termination: SMD/SMT; Max Power Dissipation: 100mW; Features: Automotive AEC-Q200; Series: ERJ; Construction: Rectangular; Technology: THICK FILM; Length: 1.6mm; Width: 0.8mm; Height: 0.45mm; Depth: 0.8mm; Ratings: AEC-Q200; Radiation Hardening: No; Reach SVHC Compliant: No; Military Standard: Not; Lead Free: Lead Free; RoHS Compliant: Yes; ComponentLink1URL: https://datasheet.ciiva.com/27055/1935748-27055113.pdf?src-supplier=Jameco; ComponentLink1Description: https://datasheet.ciiva.com/27055/1935748-27055113.pdf?src-supplier=Jameco; ComponentLink2URL: https://datasheet.ciiva.com/11808/0900766b80f806dd-11808207.pdf?src-supplier=Rs; ComponentLink2Description: https://datasheet.ciiva.com/11808/0900766b80f806dd-11808207.pdf?src-supplier=Rs; ComponentLink3URL: https://datasheet.ciiva.com/46377/1678796-46377868.pdf?src-supplier=Element14; ComponentLink3Description: https://datasheet.ciiva.com/46377/1678796-46377868.pdf?src-supplier=Element14; ComponentLink4URL: https://datasheet.ciiva.com/28695/1678796-28695833.pdf?src-supplier=Element14; ComponentLink4Description: https://datasheet.ciiva.com/28695/1678796-28695833.pdf?src-supplier=Element14; ComponentLink5URL: https://datasheet.ciiva.com/16834/aoa0000ce1-16834828.pdf?src-supplier=Future+Electronics; ComponentLink5Description: https://datasheet.ciiva.com/16834/aoa0000ce1-16834828.pdf?src-supplier=Future+Electronics; ComponentLink6URL: https://datasheet.ciiva.com/48532/aoa0000ce1-48532165.pdf?src-supplier=Avnet; ComponentLink6Description: https://datasheet.ciiva.com/48532/aoa0000ce1-48532165.pdf?src-supplier=Avnet; ComponentLink7URL: https://datasheet.ciiva.com/5959/1678796-5959707.pdf?src-supplier=Farnell; ComponentLink7Description: https://datasheet.ciiva.com/5959/1678796-5959707.pdf?src-supplier=Farnell; ComponentLink8URL: https://datasheet.ciiva.com/16758/70255313-16758527.pdf?src-supplier=Allied+Electronics; ComponentLink8Description: https://datasheet.ciiva.com/16758/70255313-16758527.pdf?src-supplier=Allied+Electronics; ComponentLink9URL: https://datasheet.ciiva.com/9198/aoa0000ce1-9198975.pdf?src-supplier=Avnet; ComponentLink9Description: https://datasheet.ciiva.com/9198/aoa0000ce1-9198975.pdf?src-supplier=Avnet; ComponentLink10URL: https://datasheet.ciiva.com/30199/4aoa0000ce1-30199822.pdf?src-supplier=Onlinecomponents.com; ComponentLink10Description: https://datasheet.ciiva.com/30199/4aoa0000ce1-30199822.pdf?src-supplier=Onlinecomponents.com; ComponentLink11URL: https://datasheet.ciiva.com/43460/1678796-43460647.pdf?src-supplier=Farnell; ComponentLink11Description: https://datasheet.ciiva.com/43460/1678796-43460647.pdf?src-supplier=Farnell
R138 R140 R141 = RCA060310K0FKEAHP: as R166 on sheet DIGITAL_I-O_O-P; Supplier: Future Electronics; Supplier Part Number: 4171415; Manufacturer Part Number: RCA060310K0FKEAHP; RoHS: Yes; Category: Chip SMD Resistors; Stock: 10000; Pricing: 5000=0.0413, 10000=0.0403, 15000=0.0397, 25000=0.0389, 50000=0.0374 (USD); Case/Package: 0603; Case Code (Imperial): 0603; Case Code (Metric): 1608; Min Operating Temperature: -55°C; Max Operating Temperature: 155°C; Features: Automotive AEC-Q200,Anti-Sulfur; Packaging: Cut Tape; Tolerance: 1%; Number of Terminations: 2; Series: RCA-HP; Ratings: AEC-Q200; RoHS Compliant: Yes; ComponentLink1URL: http://www.vishay.com/docs/20067/rcahp.pdf?src-supplier=Digi-Key; ComponentLink1Description: http://www.vishay.com/docs/20067/rcahp.pdf?src-supplier=Digi-Key
TP3-TP7 = TEST POINT: Test Point ON; Item Type: TEST POINT
U28 = LD29300P2MTR: IC REG LINEAR POS ADJ 3A P2PAK-4; Manufacturer: STMicroelectronics; Supplier: Mouser; Supplier Part Number: 511-LD29300P2MTR; Manufacturer Part Number: LD29300P2MTR; RoHS: Yes; Category: Voltage Regulators - Linear; Stock: 29557; Pricing: 1=1.81, 10=1.63, 50=1.54, 100=1.31, 1000=0.908, 10000=0.886 (USD); ComponentLink1URL: https://datasheet.ciiva.com/17077/ld29300p2mtr-17077916.pdf?src-supplier=Allied+Electronics; ComponentLink1Description: https://datasheet.ciiva.com/17077/ld29300p2mtr-17077916.pdf?src-supplier=Allied+Electronics; ComponentLink2URL: https://datasheet.ciiva.com/41440/001185831-da-01-en-ic-reg-ldo-adj-ld29300p2mtr-to-263-6-stm-41440915.pdf?src-supplier=Conrad; ComponentLink2Description: https://datasheet.ciiva.com/41440/001185831-da-01-en-ic-reg-ldo-adj-ld29300p2mtr-to-263-6-stm-41440915.pdf?src-supplier=Conrad; ComponentLink3URL: https://datasheet.ciiva.com/2044/cd00003208-2044196.pdf?src-supplier=Digi-Key; ComponentLink3Description: https://datasheet.ciiva.com/2044/cd00003208-2044196.pdf?src-supplier=Digi-Key; ComponentLink4URL: https://datasheet.ciiva.com/2044/cd00003208-2044197.pdf?src-supplier=Digi-Key; ComponentLink4Description: https://datasheet.ciiva.com/2044/cd00003208-2044197.pdf?src-supplier=Digi-Key; ComponentLink5URL: https://datasheet.ciiva.com/2044/cd00003208-2044198.pdf?src-supplier=Digi-Key; ComponentLink5Description: https://datasheet.ciiva.com/2044/cd00003208-2044198.pdf?src-supplier=Digi-Key